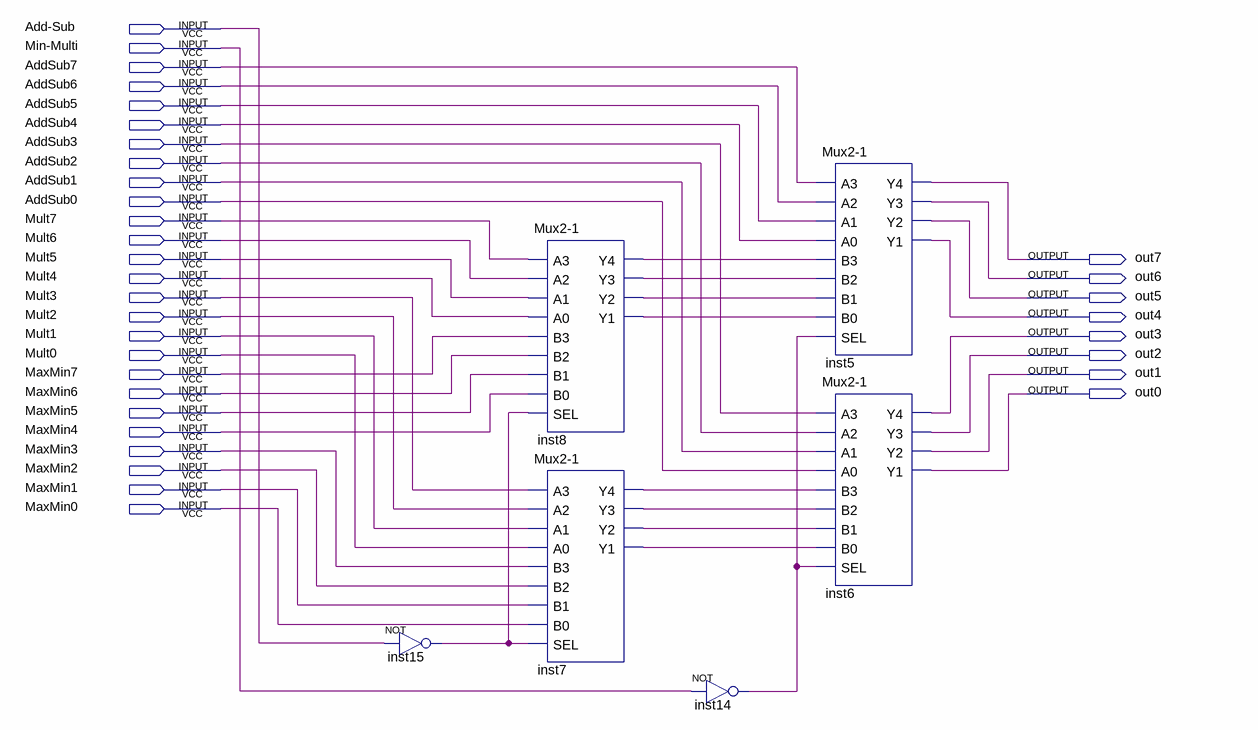
[diagram p0: schematic sheet]
// Quartus schematic cal-sel.bdf as structural Verilog: 6 symbols, 34 pins
module \cal-sel  (
  input  \Add-Sub ,
  input  \Min-Multi ,
  input  AddSub7,
  input  AddSub6,
  input  AddSub5,
  input  AddSub4,
  input  AddSub3,
  input  AddSub2,
  input  AddSub1,
  input  AddSub0,
  input  Mult7,
  input  Mult6,
  input  Mult5,
  input  Mult4,
  input  Mult3,
  input  Mult2,
  input  Mult1,
  input  Mult0,
  input  MaxMin7,
  input  MaxMin6,
  input  MaxMin5,
  input  MaxMin4,
  input  MaxMin3,
  input  MaxMin2,
  input  MaxMin1,
  input  MaxMin0,
  output out7,
  output out6,
  output out5,
  output out4,
  output out3,
  output out2,
  output out1,
  output out0
);

  wire inst7_y1, inst7_y2, inst7_y3, inst7_y4, inst8_y1, inst8_y2, inst8_y3, inst8_y4, inst14_out, inst15_out;

  not inst15 (inst15_out, \Add-Sub );
  \Mux2-1  inst8 (
    .A3(Mult7), .A2(Mult6), .A1(Mult5), .A0(Mult4), .B3(MaxMin7), .B2(MaxMin6), .B1(MaxMin5), .B0(MaxMin4),
    .SEL(inst15_out), .Y4(inst8_y4), .Y3(inst8_y3), .Y2(inst8_y2), .Y1(inst8_y1));
  \Mux2-1  inst7 (
    .A3(Mult3), .A2(Mult2), .A1(Mult1), .A0(Mult0), .B3(MaxMin3), .B2(MaxMin2), .B1(MaxMin1), .B0(MaxMin0),
    .SEL(inst15_out), .Y4(inst7_y4), .Y3(inst7_y3), .Y2(inst7_y2), .Y1(inst7_y1));
  not inst14 (inst14_out, \Min-Multi );
  \Mux2-1  inst5 (
    .A3(AddSub7), .A2(AddSub6), .A1(AddSub5), .A0(AddSub4), .B3(inst8_y4), .B2(inst8_y3), .B1(inst8_y2),
    .B0(inst8_y1), .SEL(inst14_out), .Y4(out7), .Y3(out6), .Y2(out5), .Y1(out4));
  \Mux2-1  inst6 (
    .A3(AddSub3), .A2(AddSub2), .A1(AddSub1), .A0(AddSub0), .B3(inst7_y4), .B2(inst7_y3), .B1(inst7_y2),
    .B0(inst7_y1), .SEL(inst14_out), .Y4(out3), .Y3(out2), .Y2(out1), .Y1(out0));
endmodule
